# Altium project STPMotorControl_1.PrjPcb (part 2 of 2)
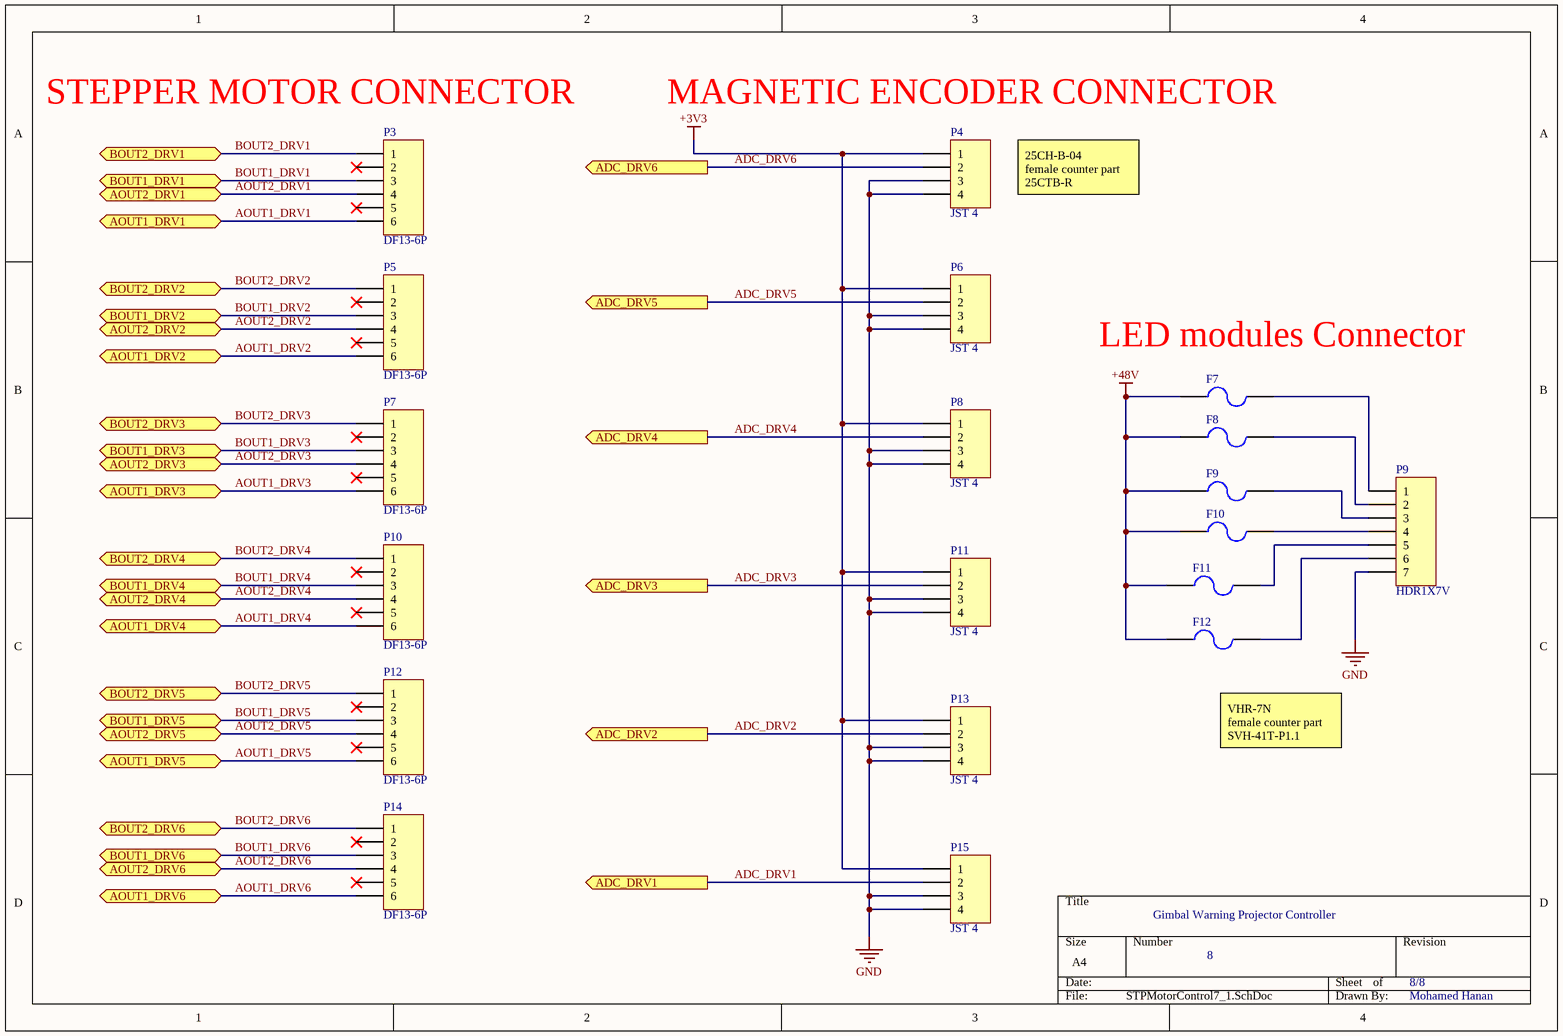
[diagram p8: STPMotorControl7_1.SchDoc]

## Nets that join several sheets
+3V3: STPMotorControl_1 (13 pins), STPMotorControl2_1 (C9.2 C10.2 IC1.3 IC1.5), STPMotorControl3_1 (8 pins), STPMotorControl4_1 (14 pins), STPMotorControl5_1 (14 pins), STPMotorControl6_1 (14 pins), STPMotorControl7_1 (6 pins)
+48V: STPMotorControl3_1 (7 pins), STPMotorControl4_1 (F1.2 F2.2), STPMotorControl5_1 (F3.2 F4.2), STPMotorControl6_1 (F5.2 F6.2), STPMotorControl7_1 (6 pins)
GND: STPMotorControl_1 (17 pins), STPMotorControl2_1 (6 pins), STPMotorControl3_1 (24 pins), STPMotorControl4_1 (26 pins), STPMotorControl5_1 (26 pins), STPMotorControl6_1 (26 pins), STPMotorControl7_1 (13 pins)
ADC_DRV1: STPMotorControl_1 (U1.14), STPMotorControl7_1 (P15.2)
ADC_DRV2: STPMotorControl_1 (U1.15), STPMotorControl7_1 (P13.2)
ADC_DRV3: STPMotorControl_1 (U1.16), STPMotorControl7_1 (P11.2)
ADC_DRV4: STPMotorControl_1 (U1.17), STPMotorControl7_1 (P8.2)
ADC_DRV5: STPMotorControl_1 (U1.20), STPMotorControl7_1 (P6.2)
ADC_DRV6: STPMotorControl_1 (U1.21), STPMotorControl7_1 (P4.2)
AOUT1_DRV1: STPMotorControl4_1 (IC4.4 IC4.5 IC4.6), STPMotorControl7_1 (P3.6)
AOUT1_DRV2: STPMotorControl4_1 (IC3.4 IC3.5 IC3.6), STPMotorControl7_1 (P5.6)
AOUT1_DRV3: STPMotorControl5_1 (IC6.4 IC6.5 IC6.6), STPMotorControl7_1 (P7.6)
AOUT1_DRV4: STPMotorControl5_1 (IC5.4 IC5.5 IC5.6), STPMotorControl7_1 (P10.6)
AOUT1_DRV5: STPMotorControl6_1 (IC8.4 IC8.5 IC8.6), STPMotorControl7_1 (P12.6)
AOUT1_DRV6: STPMotorControl6_1 (IC7.4 IC7.5 IC7.6), STPMotorControl7_1 (P14.6)
AOUT2_DRV1: STPMotorControl4_1 (IC4.7 IC4.8 IC4.9), STPMotorControl7_1 (P3.4)
AOUT2_DRV2: STPMotorControl4_1 (IC3.7 IC3.8 IC3.9), STPMotorControl7_1 (P5.4)
AOUT2_DRV3: STPMotorControl5_1 (IC6.7 IC6.8 IC6.9), STPMotorControl7_1 (P7.4)
AOUT2_DRV4: STPMotorControl5_1 (IC5.7 IC5.8 IC5.9), STPMotorControl7_1 (P10.4)
AOUT2_DRV5: STPMotorControl6_1 (IC8.7 IC8.8 IC8.9), STPMotorControl7_1 (P12.4)
AOUT2_DRV6: STPMotorControl6_1 (IC7.7 IC7.8 IC7.9), STPMotorControl7_1 (P14.4)
BOUT1_DRV1: STPMotorControl4_1 (IC4.14 IC4.15 IC4.16), STPMotorControl7_1 (P3.3)
BOUT1_DRV2: STPMotorControl4_1 (IC3.14 IC3.15 IC3.16), STPMotorControl7_1 (P5.3)
BOUT1_DRV3: STPMotorControl5_1 (IC6.14 IC6.15 IC6.16), STPMotorControl7_1 (P7.3)
BOUT1_DRV4: STPMotorControl5_1 (IC5.14 IC5.15 IC5.16), STPMotorControl7_1 (P10.3)
BOUT1_DRV5: STPMotorControl6_1 (IC8.14 IC8.15 IC8.16), STPMotorControl7_1 (P12.3)
BOUT1_DRV6: STPMotorControl6_1 (IC7.14 IC7.15 IC7.16), STPMotorControl7_1 (P14.3)
BOUT2_DRV1: STPMotorControl4_1 (IC4.17 IC4.18 IC4.19), STPMotorControl7_1 (P3.1)
BOUT2_DRV2: STPMotorControl4_1 (IC3.17 IC3.18 IC3.19), STPMotorControl7_1 (P5.1)
BOUT2_DRV3: STPMotorControl5_1 (IC6.17 IC6.18 IC6.19), STPMotorControl7_1 (P7.1)
BOUT2_DRV4: STPMotorControl5_1 (IC5.17 IC5.18 IC5.19), STPMotorControl7_1 (P10.1)
BOUT2_DRV5: STPMotorControl6_1 (IC8.17 IC8.18 IC8.19), STPMotorControl7_1 (P12.1)
BOUT2_DRV6: STPMotorControl6_1 (IC7.17 IC7.18 IC7.19), STPMotorControl7_1 (P14.1)
DIR_DRV1: STPMotorControl_1 (U1.37), STPMotorControl4_1 (IC4.40)
DIR_DRV2: STPMotorControl_1 (U1.36), STPMotorControl4_1 (IC3.40)
DIR_DRV3: STPMotorControl_1 (U1.29), STPMotorControl5_1 (IC6.40)
DIR_DRV4: STPMotorControl_1 (U1.28), STPMotorControl5_1 (IC5.40)
DIR_DRV5: STPMotorControl_1 (U1.27), STPMotorControl6_1 (IC8.40)
DIR_DRV6: STPMotorControl_1 (U1.26), STPMotorControl6_1 (IC7.40)
ENABLE_DRV_ALL: STPMotorControl_1 (R1.2 U1.62), STPMotorControl4_1 (IC3.41 IC4.41), STPMotorControl5_1 (IC5.41 IC6.41), STPMotorControl6_1 (IC7.41 IC8.41)
FDCAN1_RX: STPMotorControl_1 (U1.33), STPMotorControl2_1 (IC1.4)
FDCAN1_TX: STPMotorControl_1 (U1.34), STPMotorControl2_1 (IC1.1)
NFAULT_DRV1: STPMotorControl_1 (U1.1), STPMotorControl4_1 (IC4.26 R15.2)
NFAULT_DRV2: STPMotorControl_1 (U1.2), STPMotorControl4_1 (IC3.26 R12.2)
NFAULT_DRV3: STPMotorControl_1 (U1.3), STPMotorControl5_1 (IC6.26 R21.2)
NFAULT_DRV4: STPMotorControl_1 (U1.4), STPMotorControl5_1 (IC5.26 R18.2)
NFAULT_DRV5: STPMotorControl_1 (U1.8), STPMotorControl6_1 (IC8.26 R27.2)
NFAULT_DRV6: STPMotorControl_1 (U1.9), STPMotorControl6_1 (IC7.26 R24.2)
NHOME_DRV1: STPMotorControl_1 (U1.22), STPMotorControl4_1 (IC4.27 R16.2)
NHOME_DRV2: STPMotorControl_1 (U1.23), STPMotorControl4_1 (IC3.27 R13.2)
NHOME_DRV3: STPMotorControl_1 (U1.24), STPMotorControl5_1 (IC6.27 R22.2)
NHOME_DRV4: STPMotorControl_1 (U1.25), STPMotorControl5_1 (IC5.27 R19.2)
NHOME_DRV5: STPMotorControl_1 (U1.10), STPMotorControl6_1 (IC8.27 R28.2)
NHOME_DRV6: STPMotorControl_1 (U1.11), STPMotorControl6_1 (IC7.27 R25.2)
OSC_IN: STPMotorControl_1 (U1.5), STPMotorControl3_1 (R10.2)
OSC_OUT: STPMotorControl_1 (U1.6), STPMotorControl3_1 (R11.1)
RESET: STPMotorControl_1 (J1.3 U1.7), STPMotorControl3_1 (C22.2 D3.2 R9.1 SW1.1)
SPI2_MISO: STPMotorControl_1 (U1.38), STPMotorControl4_1 (IC3.36 IC4.36), STPMotorControl5_1 (IC5.36 IC6.36), STPMotorControl6_1 (IC7.36 IC8.36)
SPI2_MOSI: STPMotorControl_1 (U1.41), STPMotorControl4_1 (IC3.37 IC4.37), STPMotorControl5_1 (IC5.37 IC6.37), STPMotorControl6_1 (IC7.37 IC8.37)
SPI2_NSS_DRV1: STPMotorControl_1 (U1.58), STPMotorControl4_1 (IC4.34)
SPI2_NSS_DRV2: STPMotorControl_1 (U1.57), STPMotorControl4_1 (IC3.34)
SPI2_NSS_DRV3: STPMotorControl_1 (U1.54), STPMotorControl5_1 (IC6.34)
SPI2_NSS_DRV4: STPMotorControl_1 (U1.52), STPMotorControl5_1 (IC5.34)
SPI2_NSS_DRV5: STPMotorControl_1 (U1.51), STPMotorControl6_1 (IC8.34)
SPI2_NSS_DRV6: STPMotorControl_1 (U1.40), STPMotorControl6_1 (IC7.34)
SPI2_SCK: STPMotorControl_1 (U1.42), STPMotorControl4_1 (IC3.38 IC4.38), STPMotorControl5_1 (IC5.38 IC6.38), STPMotorControl6_1 (IC7.38 IC8.38)
TIM2_CH1_STEP: STPMotorControl_1 (U1.50), STPMotorControl4_1 (IC4.39)
TIM5_CH1_STEP: STPMotorControl_1 (U1.56), STPMotorControl4_1 (IC3.39)
TIM12_CH1_STEP: STPMotorControl_1 (U1.35), STPMotorControl5_1 (IC6.39)
TIM15_CH1_STEP: STPMotorControl_1 (U1.53), STPMotorControl5_1 (IC5.39)
TIM16_CH1_STEP: STPMotorControl_1 (U1.59), STPMotorControl6_1 (IC8.39)
TIM17_CH1_STEP: STPMotorControl_1 (U1.61), STPMotorControl6_1 (IC7.39)